# Altium project DL_Control_board_Rev0.PrjPcb (part 2 of 2)

## Sheet Flow_sensor.SchDoc
size 420 x 297 mm; Address1: Address1; Address2: Address2; Address3: Address3; Address4: Address4; DocumentNumber: *Э3; SheetNumber: 11; SheetTotal: 11; DocumentType: Схема электрическая *
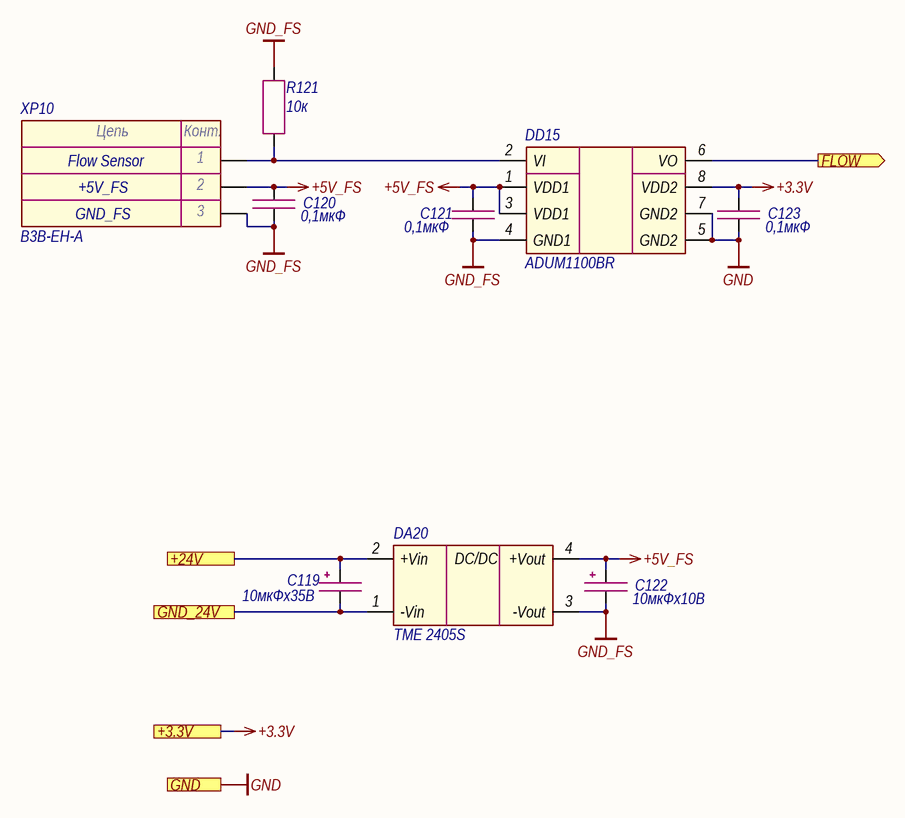
[diagram p10: Flow_sensor.SchDoc]

### Parts
C119  10мкФх35B  [CAP_C]
C120  0,1мкФ  [CAP_0603]
C121  0,1мкФ  [CAP_0603]
C122  10мкФх10B  [CAP_A]
C123  0,1мкФ  [CAP_0603]
DA20  TME 2405S  [TME (SIP-4)]
DD15  ADUM1100BR  [SOIC-8]
R121  10к  [RES_0603]
XP10  B3B-EH-A  [B3B-EH-A]

### Ports
+3.3V (see Main[2C], Ethernet[3D], Fiber_interlock[2C], Hardwiring[3D], LD_driver[1D], Power_supply[1D]), +24V (see Main[2C], Hardwiring[3C], Indication[1C], LD_driver[1D], Power_supply[1D]), FLOW (out, see Main[2C]), GND (see Main[2C], Ethernet[3D], Fiber_interlock[2C], Guide_laser[1C], Hardwiring[3D], Indication[1C], LD_driver[1D], Power_supply[1D]), GND_24V (see Main[2C], Hardwiring[3C], Indication[1C], LD_driver[1D], Power_supply[1D])

### Nets
+3.3V: C123.1 DD15.8(VDD2) ; port +3.3V
+5V_FS: C120.1 C121.1 C122.1 DA20.4(+Vout) DD15.1(VDD1) DD15.3(VDD1) XP10.2
+24V: C119.1 DA20.2(+Vin) ; port +24V
GND: C123.2 DD15.5(GND2) DD15.7(GND2) ; port GND
GND_24V: C119.2 DA20.1(-Vin) ; port GND_24V
GND_FS: C120.2 C121.2 C122.2 DA20.3(-Vout) DD15.4(GND1) R121.2 XP10.3
FLOW: DD15.6(VO) ; port FLOW
NetDD15_2: DD15.2(VI) R121.1 XP10.1

### Notes on the sheet
- +5V_FS
- Flow Sensor
- GND_FS
- Подп. и дата
- Инв. № дубл.
- Взам. инв. №
- Инв. № подл.
- Изм.
- Лист
- № докум.
- Подп.
- Дата
- Копировал
- Формат А3
- (in symbol Connector-3) Цепь; Конт.
- (in symbol TME) DC/DC

### Library data of the parts
C119 = Capacitor_Polar: Model: TECAP, 10 мкФ, 35 В, тип C, 10%; Value: 10мкФх35B; Document: *; Manufacturer: *
C120 C121 C123 = Capacitor: Manufacturer: Murata; Model: GRM188R71H104KA93D; Value: 0,1мкФ; Document: *
C122 = Capacitor_Polar: Model: TECAP, 10 мкФ, 10 В, тип A, 10%; Value: 10мкФх10B; Document: *; Manufacturer: *
DA20 = TME: Manufacturer: Traco Power; Model: TME 2405S; Document: *
DD15 = ADUM1100: Manufacturer: Analog Devices; Model: ADUM1100BR; Document: *
R121 = Resistor: Manufacturer: Yageo; Model: RC0603FR-0710KL; Value: 10к; Document: *
XP10 = Connector-3: Manufacturer: JST; Model: B3B-EH-A; Document: *

## Nets that join several sheets
+3.3V: Main (36 pins), A8 (8 pins), A9 (8 pins), A5 (7 pins), A6 (7 pins), A7 (7 pins), Hardwiring (12 pins), Ethernet (10 pins), Fiber_interlock (C80.1 DD10.5 R55.2), Flow_sensor (C123.1 DD15.8), A10 (8 pins)
+3.3VA: Main (6 pins), A1 (C41A1.1 C42A1.1 DA5A1.4 R19A1.3), A3 (R20A3.1), A2 (C41A2.1 C42A2.1 DA5A2.4 R19A2.3), A4 (R20A4.1)
+5V: Main (8 pins), Guide_laser (5 pins)
+5VA: Main (C3.1 L1.2), A1 (C37A1.1 C38A1.1 DA4A1.7 DA4A1.8), A2 (C37A2.1 C38A2.1 DA4A2.7 DA4A2.8), A8 (C61A8.1 C67A8.1 DA11A8.2 U1A8.8), A9 (C61A9.1 C67A9.1 DA11A9.2 U1A9.8), Hardwiring (C102.1 C105.1 DA16.2 U5.8), A10 (C61A10.1 C67A10.1 DA11A10.2 U1A10.8)
+24V: Main (C1.1 DA1.2 XP2.1), A8 (C52A8.1 DA9A8.2), A9 (C52A9.1 DA9A9.2), A5 (C44A5.1 DA6A5.2), A6 (C44A6.1 DA6A6.2), A7 (C44A7.1 DA6A7.2), Indication (XP7.1 XP7.3 XP7.5), Hardwiring (C110.1 DA17.2), Flow_sensor (C119.1 DA20.2), A10 (C52A10.1 DA9A10.2)
-5VA: Main (C19.1 L3.2), A1 (C35A1.2 C36A1.1 DA4A1.4 R13A1.1), A2 (C35A2.2 C36A2.1 DA4A2.4 R13A2.1)
AGND: Main (13 pins), A1 (15 pins), A3 (C43A3.2), A2 (15 pins), A4 (C43A4.2), A8 (7 pins), A9 (7 pins), Hardwiring (7 pins), A10 (7 pins)
GND: Main (53 pins), A8 (11 pins), A9 (11 pins), A5 (6 pins), A6 (6 pins), A7 (6 pins), Indication (U2.2 U3.2 U4.2), Hardwiring (15 pins), Ethernet (31 pins), Guide_laser (9 pins), Fiber_interlock (C79.2 C80.2 DD10.3 XP8.2), Flow_sensor (C123.2 DD15.5 DD15.7), A10 (11 pins)
GND_24V: Main (C1.2 DA1.1 XP2.2), A8 (C52A8.2 DA9A8.1), A9 (C52A9.2 DA9A9.1), A5 (C44A5.2 DA6A5.1), A6 (C44A6.2 DA6A6.1), A7 (C44A7.2 DA6A7.1), Indication (U2.3 U3.3 U4.3), Hardwiring (C110.2 DA17.1), Flow_sensor (C119.2 DA20.1), A10 (C52A10.2 DA9A10.1)
CRASH_IND: Main (DD1.3), Indication (R53.2)
DRV1_ADC: Main (DD1.40), A8 (C74A8.1 R42A8.2)
DRV1_AN_MOD: Main (DD1.100), A8 (DD6A8.5)
DRV1_DIG_MOD: Main (DD1.96), A8 (DA8A8.3 DD5A8.1)
DRV1_ERR1: Main (DD1.82), A8 (DD9A8.7)
DRV1_ERR2: Main (DD1.85), A8 (DD9A8.6)
DRV1_ON: Main (DD1.80), A8 (DD6A8.3 R36A8.2)
DRV1_SEL_DIG: Main (DD1.81), A8 (DA8A8.6)
DRV2_ADC: Main (DD1.41), A9 (C74A9.1 R42A9.2)
DRV2_AN_MOD: Main (DD1.101), A9 (DD6A9.5)
DRV2_DIG_MOD: Main (DD1.97), A9 (DA8A9.3 DD5A9.1)
DRV2_ERR1: Main (DD1.88), A9 (DD9A9.7)
DRV2_ERR2: Main (DD1.89), A9 (DD9A9.6)
DRV2_ON: Main (DD1.86), A9 (DD6A9.3 R36A9.2)
DRV2_SEL_DIG: Main (DD1.87), A9 (DA8A9.6)
DRV3_ADC: Main (DD1.42), A10 (C74A10.1 R42A10.2)
DRV3_AN_MOD: Main (DD1.102), A10 (DD6A10.5)
DRV3_DIG_MOD: Main (DD1.98), A10 (DA8A10.3 DD5A10.1)
DRV3_ERR1: Main (DD1.92), A10 (DD9A10.7)
DRV3_ERR2: Main (DD1.93), A10 (DD9A10.6)
DRV3_ON: Main (DD1.90), A10 (DD6A10.3 R36A10.2)
DRV3_SEL_DIG: Main (DD1.91), A10 (DA8A10.6)
EMIS_IND: Main (DD1.2), Indication (R52.2)
ETH_CS: Main (DD1.110), Ethernet (DD11.29)
ETH_INT: Main (DD1.115), Ethernet (DD11.47)
ETH_MISO: Main (DD1.112), Ethernet (DD11.33)
ETH_MOSI: Main (DD1.113), Ethernet (DD11.32)
ETH_RST: Main (DD1.114), Ethernet (DD11.48 R70.1)
ETH_SCLK: Main (DD1.111), Ethernet (DD11.30)
EXT_AN_MOD: Main (DD1.43), Hardwiring (C109.1 R99.2)
EXT_COM1: Main (DD1.63), Hardwiring (DD13.13)
EXT_COM2: Main (DD1.64), Hardwiring (DD13.12)
EXT_COM3: Main (DD1.65), Hardwiring (DD13.11)
EXT_DIG_MOD: Main (DD1.75), A8 (DD5A8.2), A9 (DD5A9.2), Hardwiring (DD13.14), A10 (DD5A10.2)
EXT_FLAG1: Main (DD1.66), Hardwiring (R100.2)
EXT_FLAG2: Main (DD1.67), Hardwiring (R101.2)
EXT_FLAG3: Main (DD1.68), Hardwiring (R102.2)
EXT_FLAG4: Main (DD1.69), Hardwiring (R103.2)
EXT_IL1: Main (DD1.57), Hardwiring (R91.2 U6.16)
EXT_IL2: Main (DD1.58), Hardwiring (R92.2 U6.14)
EXT_KEY: Main (DD1.59), Hardwiring (R94.2 U6.12)
EXT_MP_EN: Main (DD1.60), Hardwiring (R96.2 U6.10)
EXT_PMO: Main (DD1.70), Hardwiring (DD14.2)
EXT_RxCAN: Main (DD1.73), Hardwiring (DD12.3)
EXT_TxCAN: Main (DD1.74), Hardwiring (DD12.2)
FIBER_IL: Main (DD1.5), Fiber_interlock (DD10.4)
FLOW: Main (DD1.4), Flow_sensor (DD15.6)
GUIDE_LAS: Main (DD1.21), Guide_laser (R43.2 R44.1)
PD1_A: Main (XP1.2), A1 (R13A1.2 R14A1.1)
PD1_ADC: Main (DD1.34), A1 (C39A1.1 R17A1.2)
PD1_C: Main (XP1.1), A1 (C34A1.2 DA4A1.2 R12A1.1)
PD1_ERR: Main (DD1.28), A1 (DA5A1.5)
PD2_A: Main (XP1.5), A2 (R13A2.2 R14A2.1)
PD2_ADC: Main (DD1.35), A2 (C39A2.1 R17A2.2)
PD2_C: Main (XP1.4), A2 (C34A2.2 DA4A2.2 R12A2.1)
PD2_ERR: Main (DD1.29), A2 (DA5A2.5)
POWER_IND: Main (DD1.1), Indication (R51.2)
PS1_ERR1: Main (DD1.117), A5 (DD4A5.14)
PS1_ERR2: Main (DD1.118), A5 (DD4A5.13)
PS1_ERR3: Main (DD1.119), A5 (DD4A5.12)
PS1_ON: Main (DD1.116), A5 (DD4A5.11 R22A5.2 R23A5.2)
PS1_PV: Main (DD1.136), A5 (DD3A5.2)
PS2_ERR1: Main (DD1.123), A6 (DD4A6.14)
PS2_ERR2: Main (DD1.124), A6 (DD4A6.13)
PS2_ERR3: Main (DD1.125), A6 (DD4A6.12)
PS2_ON: Main (DD1.122), A6 (DD4A6.11 R22A6.2 R23A6.2)
PS2_PV: Main (DD1.137), A6 (DD3A6.2)
PS3_ERR1: Main (DD1.127), A7 (DD4A7.14)
PS3_ERR2: Main (DD1.128), A7 (DD4A7.13)
PS3_ERR3: Main (DD1.129), A7 (DD4A7.12)
PS3_ON: Main (DD1.126), A7 (DD4A7.11 R22A7.2 R23A7.2)
PS3_PV: Main (DD1.139), A7 (DD3A7.2)
T1: Main (XP1.7), A3 (R20A3.2 R21A3.1)
T1_ADC: Main (DD1.36), A3 (C43A3.1 R21A3.2)
T2: Main (XP1.9), A4 (R20A4.2 R21A4.1)
T2_ADC: Main (DD1.37), A4 (C43A4.1 R21A4.2)